# Altium project B5819W_C7420330.PrjPcb
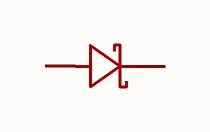
[diagram p0: B5819W_C7420330.schdoc]
1 sheet, 1 parts. Net scope: global (net labels, ports and power ports of the same name join across sheets).

## Sheet B5819W_C7420330.schdoc
size 127 x 101 mm

### Parts
D?  b5819w_c7420330  [SOD-123_L2.7-W1.6-LS3.7-FD]  (value not drawn)

### Nets

Not connected (* = marked no-connect by the designer): D? 1(A) 2(K)

### Library data of the parts
D? = b5819w_c7420330: 二极管配置:独立式;正向压降(Vf):600mV@1.0A;直流反向耐压(Vr):40V;整流电流:1A;; Manufacturer: R+O(宏嘉诚); ManufacturerPart: B5819W; AddInBom: yes; ModelId: 5054d9b7be8b429dad093a54b517b4dd; ModelTransform: 145.669,61.024,0,0,0,0,0,0,0; Diode Configuration: 独立式; Voltage - DC Reverse(Vr): 40V; Current - Rectified: 1A; Reverse Leakage Current (Ir): 1mA@30V; Operating Junction Temperature Range: -55℃~+150℃; Non-Repetitive Peak Forward Surge Current: 9A; Symbol: B5819W_C7420330; LCSC Part Name: 电压:40V 电流:1A; SupplierPart: C7420330; Supplier Footprint: SOD-123; JLCPCB Part Class: Extended Part; Datasheet: https://item.szlcsc.com/datasheet/B5819W/8397152.html; Supplier: LCSC; ConvertToPcb: yes; FootprintName: SOD-123_L2.7-W1.6-LS3.7-FD; ModelName: SOD-123_L2.7-W1.6-LS3.7-FD; Voltage - Forward(Vf@If): 600mV@1.0A